# Altium schematic sheet Sensor.SchDoc
size A4; SheetNumber: 3; SheetTotal: 6
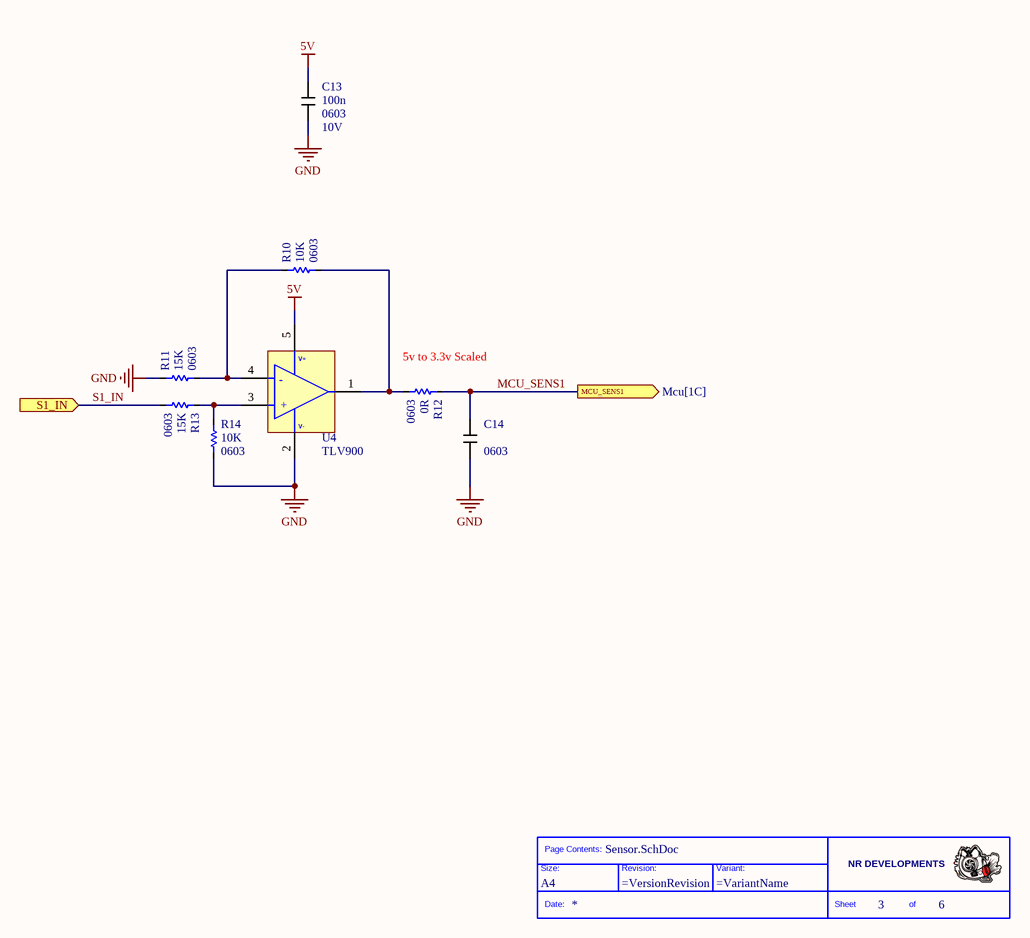
[diagram p0: Sensor.SchDoc]

## Parts
*  Size: A4  (hidden comment: Title_Block)  (graphical)
C13  value 100n  Case: 0603  Voltage: 10V  [CAPC1608X09M]  (hidden comment: C0603C104K5RACTU)
C14  Case: 0603  [CAPC1608X09M]
R10  value 10K  Case: 0603  [RESC1608X06M]  (hidden comment: CRCW060310K0FKEA)
R11  value 15K  Case: 0603  [RESC1608X06M]  (hidden comment: CRCW060315K0FKEC)
R12  value 0R  Case: 0603  [RESC1608X06M]  (hidden comment: CRCW06030000Z0EAC)
R13  value 15K  Case: 0603  [RESC1608X06M]  (hidden comment: CRCW060315K0FKEC)
R14  value 10K  Case: 0603  [RESC1608X06M]  (hidden comment: CRCW060310K0FKEA)
U4  TLV900  [SOT95P280X145-5N]

## Ports
MCU_SENS1 (out, see Mcu[1C]), S1_IN (in)

## Nets
5V: C13.1 U4.5(V+)
GND: C13.2 C14.2 R11.2 R14.1 U4.2(V-)
MCU_SENS1: C14.1 R12.2 ; port MCU_SENS1
S1_IN: R13.1 ; port S1_IN
NetR10_1: R10.1 R12.1 U4.1(OUTA)
NetR10_2: R10.2 R11.1 U4.4(IN-)
NetR13_2: R13.2 R14.2 U4.3(IN+)

## Notes on the sheet
- (near R12) 5v to 3.3v Scaled
- (in symbol Title_Block) Page Contents:; NR DEVELOPMENTS; Size:; Revision:; Variant:; Date:; Sheet; of
- (in symbol TLV900) -; +

## Library data of the parts
C13 = CAP: Manufacturer: KEMET; SMD/PTH: SMD; PartNumber: C0603C104K5RACTU
C14 = CAP
R10 R11 R13 R14 = Resistor: Manufacturer: Vishay
  R10 R14: PartNumber: CRCW060310K0FKEA
  R11 R13: PartNumber: CRCW060315K0FKEC
R12 = Resistor: Manufacturer: Vishay; PartNumber: CRCW06030000Z0EE
U4 = TLV900: Amp. op. One-channel, 1-MHz rail-to-rail input and output 1.8-V to 5.5-V operational amplifier 5-SOT-23 -40 to 125; Manufacturer: Texas Instrument; PartNumber: TLV9001IDBVR; SMD/PTH: SMD; Value: TLV9001IDBVR; Case: SOT23-5